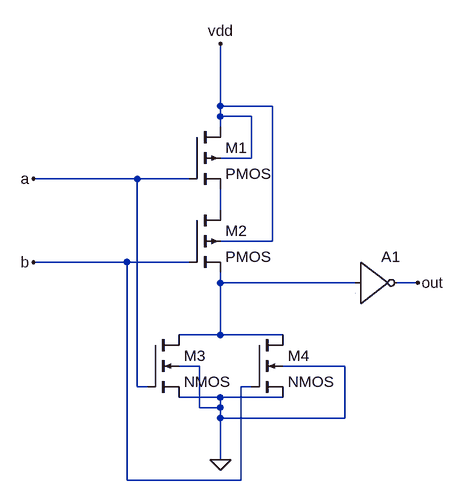
[diagram p0: schematic cmos_2input_or_gate.asc]
cmos_2input_or_gate.asc, the LTspice schematic file:
Version 4
SHEET 1 880 680
WIRE 144 16 144 -80
WIRE 224 16 144 16
WIRE 144 32 144 16
WIRE 192 32 144 32
WIRE 144 48 144 32
WIRE 192 96 192 32
WIRE 192 96 144 96
WIRE 16 128 -144 128
WIRE 96 128 16 128
WIRE 144 176 144 144
WIRE 224 224 224 16
WIRE 224 224 144 224
WIRE 0 256 -144 256
WIRE 96 256 0 256
WIRE 144 288 144 272
WIRE 352 288 144 288
WIRE 448 288 416 288
WIRE 144 368 144 288
WIRE 144 368 80 368
WIRE 240 368 144 368
WIRE 112 416 80 416
WIRE 336 416 240 416
WIRE 16 448 16 128
WIRE 32 448 16 448
WIRE 192 448 176 448
WIRE 144 464 80 464
WIRE 240 464 144 464
WIRE 112 480 112 416
WIRE 144 480 144 464
WIRE 144 480 112 480
WIRE 144 496 144 480
WIRE 336 496 336 416
WIRE 336 496 144 496
WIRE 144 560 144 496
WIRE 0 592 0 256
WIRE 176 592 176 448
WIRE 176 592 0 592
FLAG 144 560 0
FLAG -144 128 a
FLAG -144 256 b
FLAG 144 -80 vdd
FLAG 448 288 out
SYMBOL pmos4 96 48 R0
SYMATTR InstName M1
SYMBOL pmos4 96 176 R0
SYMATTR InstName M2
SYMBOL nmos4 32 368 R0
SYMATTR InstName M3
SYMBOL nmos4 192 368 R0
SYMATTR InstName M4
SYMBOL Digital\\inv 352 224 R0
SYMATTR InstName A1

The netlist it stands for:
* cmos_2input_or_gate.asc
M1 vdd a N001 vdd PMOS
M2 N001 b N002 vdd PMOS
M3 N002 a 0 0 NMOS
M4 N002 b 0 0 NMOS
A1 N002 0 0 0 0 out 0 0 BUF
.model NMOS NMOS
.model PMOS PMOS
.lib standard.mos
.backanno
.end